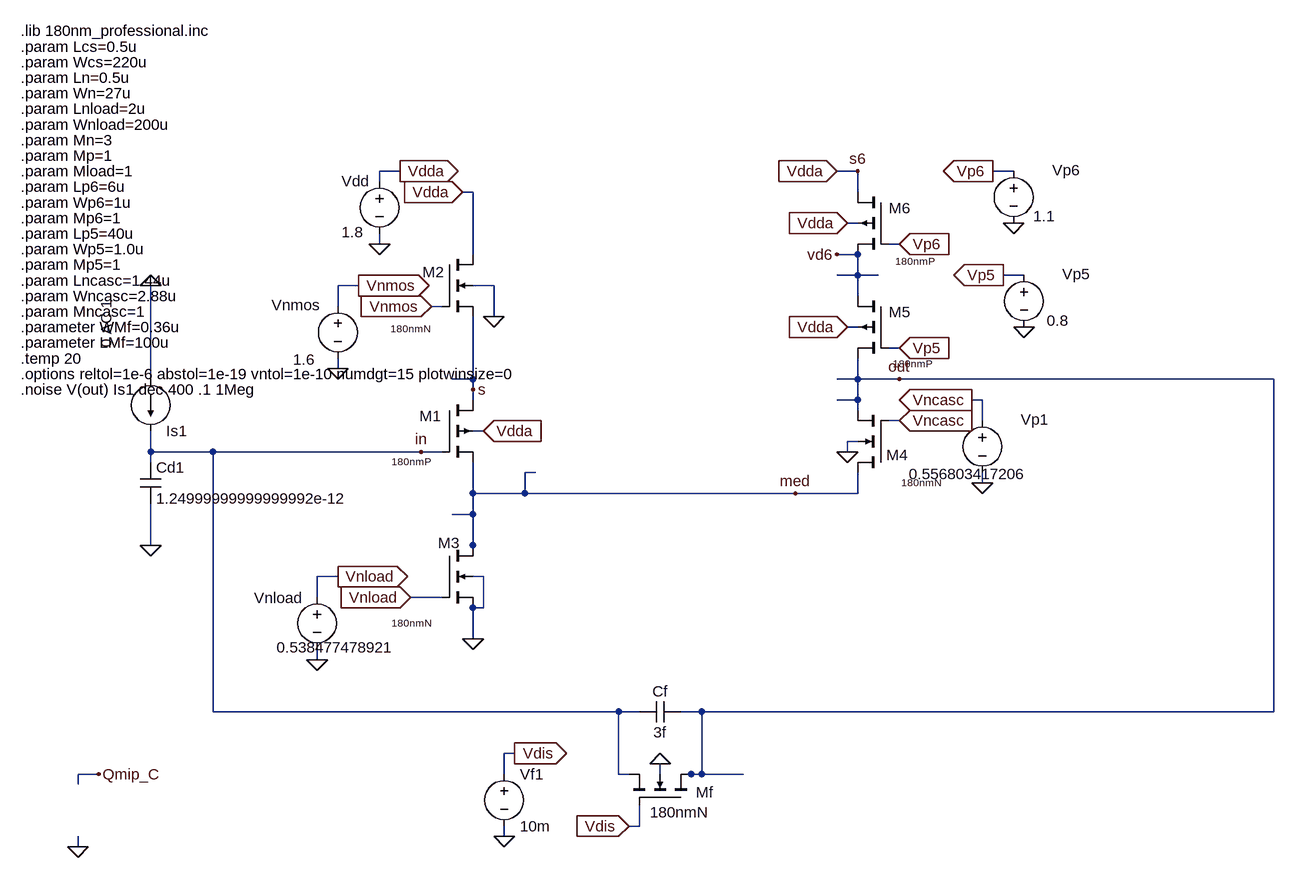
[diagram p0: schematic NAUSICA_noise.asc]
NAUSICA_noise.asc, the LTspice schematic file:
Version 4.1
SHEET 1 1220 900
WIRE -688 48 -688 -32
WIRE -304 -240 -336 -240
WIRE 400 -240 368 -240
WIRE 640 -240 608 -240
WIRE -336 -224 -336 -240
WIRE -192 -208 -208 -208
WIRE 400 -208 400 -240
WIRE 400 -160 384 -160
WIRE -336 -128 -336 -144
WIRE 464 -128 448 -128
WIRE -192 -112 -192 -208
WIRE 400 -112 368 -112
WIRE 400 -80 400 -112
WIRE 400 -80 368 -80
WIRE 432 -80 400 -80
WIRE 656 -80 624 -80
WIRE -368 -64 -400 -64
WIRE -160 -64 -192 -64
WIRE 400 -48 400 -80
WIRE -688 -32 -688 -64
WIRE -400 -32 -400 -64
WIRE -240 -32 -256 -32
WIRE -160 -16 -160 -64
WIRE 400 0 384 0
WIRE 464 32 448 32
WIRE -400 64 -400 48
WIRE -688 80 -688 48
WIRE -192 80 -192 -16
WIRE -192 80 -224 80
WIRE 400 80 400 48
WIRE 400 80 368 80
WIRE 464 80 400 80
WIRE 1040 80 464 80
WIRE -192 96 -192 80
WIRE -192 112 -192 96
WIRE 400 112 400 80
WIRE 400 112 368 112
WIRE 592 112 576 112
WIRE 400 128 400 112
WIRE 464 144 448 144
WIRE 592 144 592 112
WIRE -176 160 -192 160
WIRE 400 176 384 176
WIRE -688 192 -688 160
WIRE -592 192 -688 192
WIRE -272 192 -592 192
WIRE -240 192 -272 192
WIRE 384 192 384 176
WIRE -688 208 -688 192
WIRE -96 224 -112 224
WIRE 592 240 592 224
WIRE -192 256 -192 208
WIRE -112 256 -112 224
WIRE -112 256 -192 256
WIRE 304 256 -112 256
WIRE 400 256 400 224
WIRE 400 256 304 256
WIRE -192 288 -192 256
WIRE -192 288 -224 288
WIRE -688 336 -688 272
WIRE -192 336 -192 288
WIRE -192 352 -192 336
WIRE -400 384 -432 384
WIRE -176 384 -192 384
WIRE -432 416 -432 384
WIRE -240 416 -288 416
WIRE -176 432 -176 384
WIRE -176 432 -192 432
WIRE -192 480 -192 432
WIRE -432 512 -432 496
WIRE -592 592 -592 192
WIRE 32 592 -592 592
WIRE 64 592 32 592
WIRE 160 592 128 592
WIRE 1040 592 1040 80
WIRE 1040 592 160 592
WIRE -128 656 -144 656
WIRE -768 688 -800 688
WIRE -144 688 -144 656
WIRE 32 688 32 592
WIRE 48 688 32 688
WIRE 96 688 96 672
WIRE 144 688 128 688
WIRE 160 688 160 592
WIRE 160 688 144 688
WIRE 224 688 160 688
WIRE -800 704 -800 688
WIRE 64 768 64 736
WIRE 64 768 48 768
WIRE -144 784 -144 768
WIRE -800 800 -800 784
FLAG -192 480 0
FLAG -336 -128 0
FLAG -304 -240 Vdda
IOPIN -304 -240 Out
FLAG -208 -208 Vdda
IOPIN -208 -208 In
FLAG 304 256 med
FLAG -272 192 in
FLAG -400 64 0
FLAG -368 -64 Vnmos
IOPIN -368 -64 Out
FLAG -256 -32 Vnmos
IOPIN -256 -32 In
FLAG -160 -16 0
FLAG -176 160 Vdda
IOPIN -176 160 In
FLAG -192 96 s
FLAG -288 416 Vnload
IOPIN -288 416 In
FLAG -432 512 0
FLAG -400 384 Vnload
IOPIN -400 384 Out
FLAG 464 144 Vncasc
IOPIN 464 144 In
FLAG 384 192 0
FLAG 464 32 Vp5
IOPIN 464 32 In
FLAG 384 0 Vdda
IOPIN 384 0 In
FLAG 464 -128 Vp6
IOPIN 464 -128 In
FLAG 384 -160 Vdda
IOPIN 384 -160 In
FLAG 368 -240 Vdda
IOPIN 368 -240 In
FLAG 640 -160 0
FLAG 608 -240 Vp6
IOPIN 608 -240 Out
FLAG 656 0 0
FLAG 624 -80 Vp5
IOPIN 624 -80 Out
FLAG 592 240 0
FLAG 576 112 Vncasc
IOPIN 576 112 Out
FLAG 464 80 out
FLAG 368 -112 vd6
FLAG 400 -240 s6
FLAG 48 768 Vdis
IOPIN 48 768 In
FLAG 96 672 0
FLAG -128 656 Vdis
IOPIN -128 656 Out
FLAG -144 784 0
FLAG -688 336 0
FLAG -688 -64 0
FLAG -800 800 0
FLAG -768 688 Qmip_C
SYMBOL pmos4 -240 112 R0
WINDOW 0 -34 25 Left 2
WINDOW 3 -77 95 Left 1
SYMATTR InstName M1
SYMATTR Value 180nmP
SYMATTR Value2 l={Lcs} w={Wcs} m={Mp}
SYMBOL voltage -336 -240 R0
WINDOW 123 0 0 Left 0
WINDOW 39 0 0 Left 0
WINDOW 0 -58 15 Left 2
WINDOW 3 -58 94 Left 2
SYMATTR InstName Vdd
SYMATTR Value 1.8
SYMBOL nmos4 -240 -112 R0
WINDOW 0 -30 27 Left 2
WINDOW 3 -79 114 Left 1
SYMATTR InstName M2
SYMATTR Value 180nmN
SYMATTR Value2 l={Ln} w={Wn} m={Mn}
SYMBOL voltage -400 -48 R0
WINDOW 123 0 0 Left 0
WINDOW 39 0 0 Left 0
WINDOW 0 -102 14 Left 2
WINDOW 3 -69 98 Left 2
SYMATTR InstName Vnmos
SYMATTR Value 1.6
SYMBOL nmos4 -240 336 R0
WINDOW 0 -6 -4 Left 2
WINDOW 3 -77 119 Left 1
SYMATTR InstName M3
SYMATTR Value 180nmN
SYMATTR Value2 l={Lnload} w={Wnload} m={Mload}
SYMBOL voltage -432 400 R0
WINDOW 123 0 0 Left 0
WINDOW 39 0 0 Left 0
WINDOW 0 -97 17 Left 2
WINDOW 3 -62 93 Left 2
SYMATTR InstName Vnload
SYMATTR Value 0.538477478921
SYMBOL nmos4 448 224 R180
WINDOW 0 -30 27 Left 2
WINDOW 3 -80 -15 Left 1
SYMATTR InstName M4
SYMATTR Value 180nmN
SYMATTR Value2 l={Lncasc} w={Wncasc} m={Mncasc}
SYMBOL pmos4 448 -48 M0
WINDOW 0 -34 25 Left 2
WINDOW 3 -66 104 Left 1
SYMATTR InstName M5
SYMATTR Value 180nmP
SYMATTR Value2 l={Lcs} w={Wcs} m={Mp}
SYMBOL pmos4 448 -208 M0
WINDOW 0 -34 25 Left 2
WINDOW 3 -70 106 Left 1
SYMATTR InstName M6
SYMATTR Value 180nmP
SYMATTR Value2 l={Lp6} w={Wp6} m={Mp6}
SYMBOL voltage 640 -256 M0
WINDOW 123 0 0 Left 0
WINDOW 39 0 0 Left 0
WINDOW 0 -102 14 Left 2
WINDOW 3 -64 85 Left 2
SYMATTR InstName Vp6
SYMATTR Value 1.1
SYMBOL voltage 656 -96 M0
WINDOW 123 0 0 Left 0
WINDOW 39 0 0 Left 0
WINDOW 0 -102 14 Left 2
WINDOW 3 -69 86 Left 2
SYMATTR InstName Vp5
SYMATTR Value 0.8
SYMBOL voltage 592 128 M0
WINDOW 123 0 0 Left 0
WINDOW 39 0 0 Left 0
WINDOW 0 -102 14 Left 2
WINDOW 3 -69 98 Left 2
SYMATTR InstName Vp1
SYMATTR Value 0.556803417206
SYMBOL cap 128 576 R90
WINDOW 0 0 32 VBottom 2
WINDOW 3 32 32 VTop 2
SYMATTR InstName Cf
SYMATTR Value 3f
SYMBOL nmos4 144 736 M270
WINDOW 0 20 -7 VLeft 2
WINDOW 3 -11 64 VLeft 2
SYMATTR InstName Mf
SYMATTR Value 180nmN
SYMATTR Value2 l={LMf} w={WMf} m=1
SYMBOL voltage -144 672 R0
WINDOW 123 0 0 Left 0
WINDOW 39 0 0 Left 0
SYMATTR InstName Vf1
SYMATTR Value 10m
SYMBOL current -688 80 R0
WINDOW 0 24 80 Left 2
WINDOW 3 -68 -122 VRight 2
WINDOW 123 36 27 Left 2
WINDOW 39 0 0 Left 2
SYMATTR InstName Is1
SYMATTR Value 0 AC 1
SYMBOL cap -704 208 R0
SYMATTR InstName Cd1
SYMATTR Value 1.24999999999999992e-12
TEXT -888 -456 Left 2 !.lib 180nm_professional.inc
TEXT -888 -432 Left 2 !.param Lcs=0.5u
TEXT -888 -408 Left 2 !.param Wcs=220u
TEXT -888 -384 Left 2 !.param Ln=0.5u
TEXT -888 -360 Left 2 !.param Wn=27u
TEXT -888 -336 Left 2 !.param Lnload=2u
TEXT -888 -312 Left 2 !.param Wnload=200u
TEXT -888 -288 Left 2 !.param Mn=3
TEXT -888 -264 Left 2 !.param Mp=1
TEXT -888 -240 Left 2 !.param Mload=1
TEXT -888 -216 Left 2 !.param Lp6=6u
TEXT -888 -192 Left 2 !.param Wp6=1u
TEXT -888 -168 Left 2 !.param Mp6=1
TEXT -888 -144 Left 2 !.param Lp5=40u
TEXT -888 -120 Left 2 !.param Wp5=1.0u
TEXT -888 -96 Left 2 !.param Mp5=1
TEXT -888 -72 Left 2 !.param Lncasc=1.44u
TEXT -888 -48 Left 2 !.param Wncasc=2.88u
TEXT -888 -24 Left 2 !.param Mncasc=1
TEXT -888 0 Left 2 !.parameter WMf=0.36u
TEXT -888 24 Left 2 !.parameter LMf=100u
TEXT -888 48 Left 2 !.temp 20
TEXT -888 72 Left 2 !.options reltol=1e-6 abstol=1e-19 vntol=1e-10 numdgt=15 plotwinsize=0
TEXT -888 96 Left 2 !.noise V(out) Is1 dec 400 .1 1Meg

The netlist it stands for:
* NAUSICA_noise.asc
M1 s in med s6 180nmP l={Lcs} w={Wcs} m={Mp}
Vdd s6 0 1.8
M2 s6 Vnmos s 0 180nmN l={Ln} w={Wn} m={Mn}
Vnmos Vnmos 0 1.6
M3 med Vnload 0 0 180nmN l={Lnload} w={Wnload} m={Mload}
Vnload Vnload 0 0.538477478921
M4 med Vncasc out 0 180nmN l={Lncasc} w={Wncasc} m={Mncasc}
M5 vd6 Vp5 out s6 180nmP l={Lcs} w={Wcs} m={Mp}
M6 s6 Vp6 vd6 s6 180nmP l={Lp6} w={Wp6} m={Mp6}
Vp6 Vp6 0 1.1
Vp5 Vp5 0 0.8
Vp1 Vncasc 0 0.556803417206
Cf out in 3f
Mf out Vdis in 0 180nmN l={LMf} w={WMf} m=1
Vf1 Vdis 0 10m
Is1 0 in 0 AC 1
Cd1 in 0 1.24999999999999992e-12
.model NMOS NMOS
.model PMOS PMOS
.lib standard.mos
.lib 180nm_professional.inc
.param Lcs=0.5u
.param Wcs=220u
.param Ln=0.5u
.param Wn=27u
.param Lnload=2u
.param Wnload=200u
.param Mn=3
.param Mp=1
.param Mload=1
.param Lp6=6u
.param Wp6=1u
.param Mp6=1
.param Lp5=40u
.param Wp5=1.0u
.param Mp5=1
.param Lncasc=1.44u
.param Wncasc=2.88u
.param Mncasc=1
.parameter WMf=0.36u
.parameter LMf=100u
.temp 20
.options reltol=1e-6 abstol=1e-19 vntol=1e-10 numdgt=15 plotwinsize=0
.noise V(out) Is1 dec 400 .1 1Meg
.backanno
.end